# Altium schematic sheet CW341_HyperRam.SchDoc: CW341 HypeRAM
size Letter; Organization: NewAE Technology Inc.; Address1: 1083 Queen St., Suite 196; Address2: Halifax; Address3: NS; Address4: Canada B3H 0B2; SheetNumber: 15; SheetTotal: 16; SheetApproved: YES
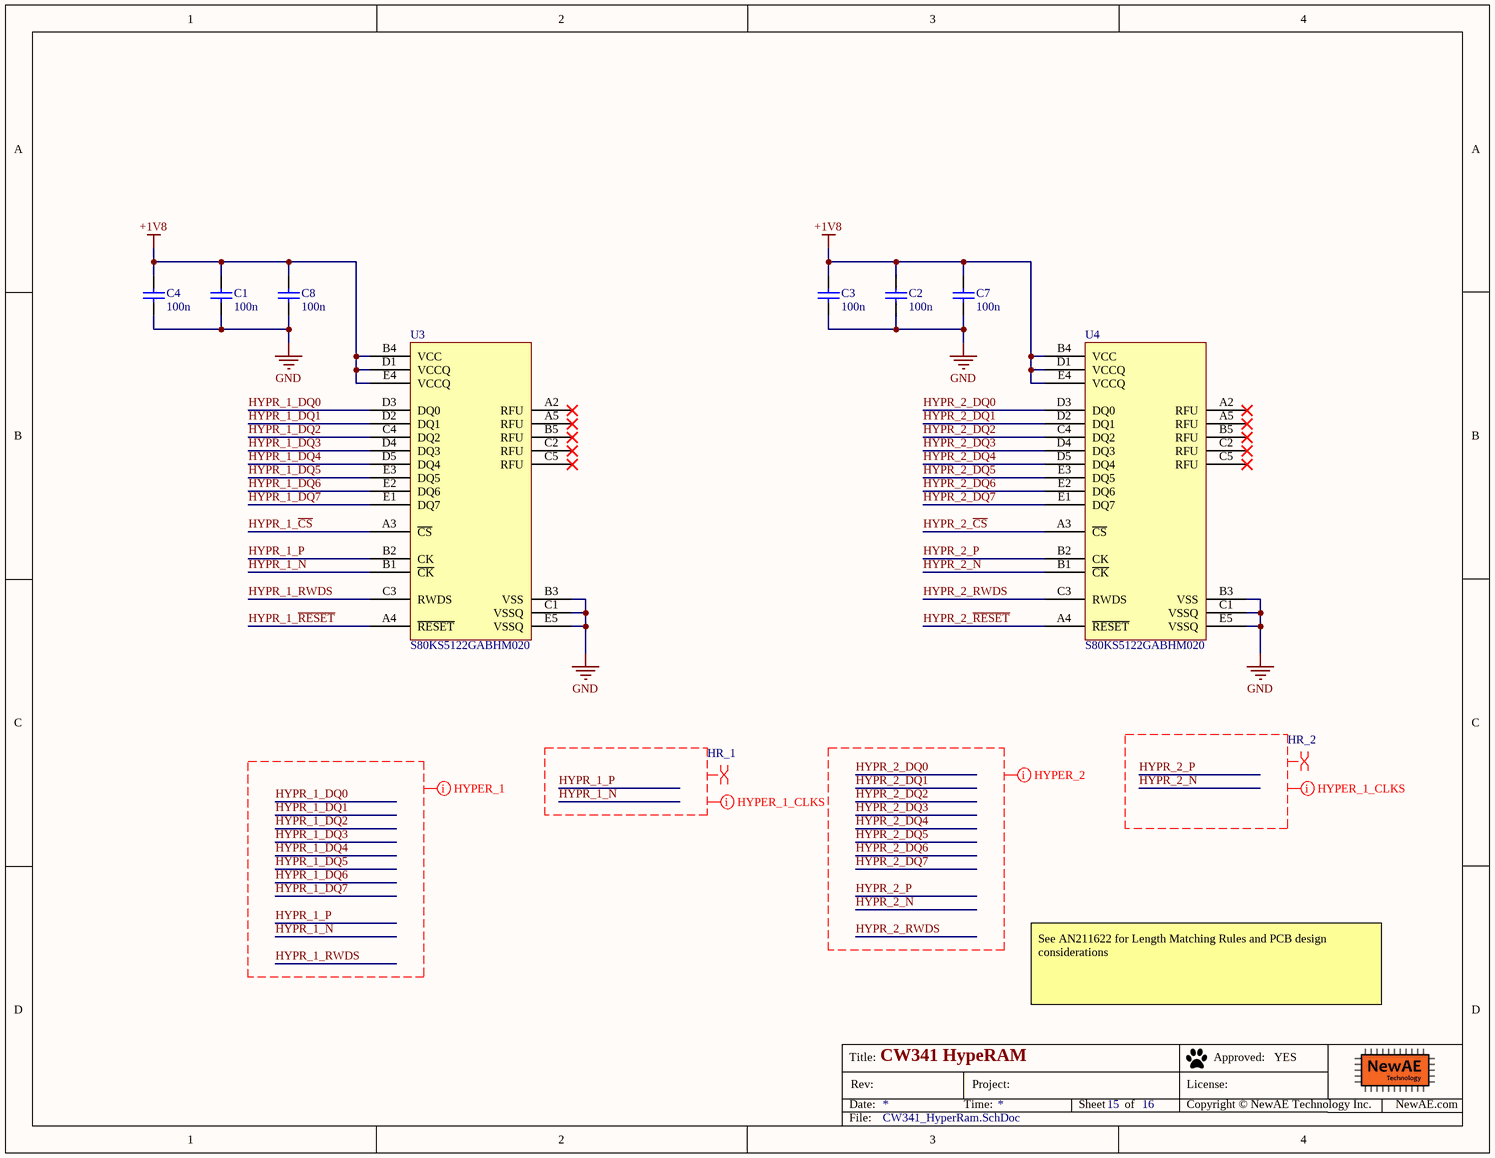
[diagram p0: CW341_HyperRam.SchDoc]

## Parts
C1  100n  [CAPC0402_M]
C2  100n  [CAPC0402_M]
C3  100n  [CAPC0402_M]
C4  100n  [CAPC0402_M]
C7  100n  [CAPC0402_M]
C8  100n  [CAPC0402_M]
U3  PSRAM 512MBIT HYPERBUS 24FBGA  [BGA_24-TBGA_HYPERRAM]  (value not drawn)
U4  PSRAM 512MBIT HYPERBUS 24FBGA  [BGA_24-TBGA_HYPERRAM]  (value not drawn)

## Nets
+1V8: C1.1 C2.1 C3.1 C4.1 C7.1 C8.1 U3.B4(VCC) U3.D1(VCCQ) U3.E4(VCCQ) U4.B4(VCC) U4.D1(VCCQ) U4.E4(VCCQ)
GND: C1.2 C2.2 C3.2 C4.2 C7.2 C8.2 U3.B3(VSS) U3.C1(VSSQ) U3.E5(VSSQ) U4.B3(VSS) U4.C1(VSSQ) U4.E5(VSSQ)
HYPR_1_~{CS}: U3.A3(~{CS})
HYPR_1_DQ0: U3.D3(DQ0)
HYPR_1_DQ1: U3.D2(DQ1)
HYPR_1_DQ2: U3.C4(DQ2)
HYPR_1_DQ3: U3.D4(DQ3)
HYPR_1_DQ4: U3.D5(DQ4)
HYPR_1_DQ5: U3.E3(DQ5)
HYPR_1_DQ6: U3.E2(DQ6)
HYPR_1_DQ7: U3.E1(DQ7)
HYPR_1_N: U3.B1(~{CK})
HYPR_1_P: U3.B2(CK)
HYPR_1_~{RESET}: U3.A4(~{RESET})
HYPR_1_RWDS: U3.C3(RWDS)
HYPR_2_~{CS}: U4.A3(~{CS})
HYPR_2_DQ0: U4.D3(DQ0)
HYPR_2_DQ1: U4.D2(DQ1)
HYPR_2_DQ2: U4.C4(DQ2)
HYPR_2_DQ3: U4.D4(DQ3)
HYPR_2_DQ4: U4.D5(DQ4)
HYPR_2_DQ5: U4.E3(DQ5)
HYPR_2_DQ6: U4.E2(DQ6)
HYPR_2_DQ7: U4.E1(DQ7)
HYPR_2_N: U4.B1(~{CK})
HYPR_2_P: U4.B2(CK)
HYPR_2_~{RESET}: U4.A4(~{RESET})
HYPR_2_RWDS: U4.C3(RWDS)

Not connected (* = marked no-connect by the designer): U3 A2(RFU)* A5(RFU)* B5(RFU)* C2(RFU)* C5(RFU)*; U4 A2(RFU)* A5(RFU)* B5(RFU)* C2(RFU)* C5(RFU)*

## Layout directives
net class HYPER_1_Length: HYPR_1_DQ0, HYPR_1_DQ1, HYPR_1_DQ2, HYPR_1_DQ3, HYPR_1_DQ4, HYPR_1_DQ5, HYPR_1_DQ6, HYPR_1_DQ7, HYPR_1_N, HYPR_1_P, HYPR_1_RWDS
differential pair; differential pair class HR_1: HYPR_1_N, HYPR_1_P
net class HYPER_1_Clks: HYPR_1_N, HYPR_1_P
net class HYPER_2_Length: HYPR_2_DQ0, HYPR_2_DQ1, HYPR_2_DQ2, HYPR_2_DQ3, HYPR_2_DQ4, HYPR_2_DQ5, HYPR_2_DQ6, HYPR_2_DQ7, HYPR_2_N, HYPR_2_P, HYPR_2_RWDS
differential pair; differential pair class HR_2: HYPR_2_N, HYPR_2_P
net class HYPER_2_Clks: HYPR_2_N, HYPR_2_P

## Notes on the sheet
- See AN211622 for Length Matching Rules and PCB design considerations
- Title:
- Date:
- Rev:
- Time:
- Project:
- Sheet
- of
- License:
- Copyright © NewAE Technology Inc.
- Approved:
- NewAE.com
- File:

## Library data of the parts
C1-C4 C7 C8 = CCHIP-100n-0402: 100n, 0402; Manufacture Part Number 1: CGA2B3X7R1V104K050BB; Component Group: Capacitor; Case-EIA: 0402; Part Number: CCHIP-100n-0402; Footprint: 0402; Pin Count: 2; Value: 100n; Mounting Technology: SMT; Component Kind: Standard; Component Type: Standard; Supplier 1: Digi-Key; Supplier Part Number 1: 445-6901-1-ND
U3 U4 = S80KS5122GABHM020: IC PSRAM 512MBIT HYPERBUS 24FBGA; Manufacture 1: Infineon Technologies; Operating Supply Voltage: 1.7V~2V; Access Time: 35ns; Address Bus Width: 8b; Max Supply Voltage: 2.5V; Min Supply Voltage: 0V; Memory Type: RAM,SRAM - Asynchronous,SDR; Memory Size: 512Mb; Max Supply Current: 44mA; Number of Ports: 1; Component Group: Digital IC; PP Material Stack: 0; Supplier 1: Digi-Key; RoHS: Yes; Category: RAM; Stock 1: 1798; Pricing 1: 1=6.76000, 10=6.21600, 25=6.08640, 50=6.06560, 135=5.44252, 270=5.27800, 540=5.01900, 1080=4.84400, 5130=4.35750 (USD); Mount: Surface Mount; Case/Package: 24-VBGA; Number of Pins: 24; Min Operating Temperature: -40°C; Max Operating Temperature: 125°C; Package Quantity: 0; Interface: HyperBus; Density: 512Mbit; Packaging: Tray; Length: 8mm; Width: 6mm; Height: 1mm; Radiation Hardening: No; REACH SVHC: No SVHC; Lead Free: Lead Free; ComponentLink3URL: https://www.infineon.com/dgdl/Infineon-S80KS5122_1.8_V_512-Mbit_HyperBus_Interface_HyperRAM_(Self-Refresh_DRAM)-DataSheet-v01_00-EN.pdf?fileId=8ac78c8c7dc4255f017dd81b77c1088f; ComponentLink3Description: https://datasheet.ciiva.com/9274/as6c8008-9274921.pdf?src-supplier=Avnet; ComponentLink4URL: https://www.infineon.com/dgdl/Infineon-S80KS5122_1.8_V_512-Mbit_HyperBus_Interface_HyperRAM_(Self-Refresh_DRAM)-DataSheet-v01_00-EN.pdf?fileId=8ac78c8c7dc4255f017dd81b77c1088f; ComponentLink4Description: https://datasheet.ciiva.com/1510/32786-1510631.pdf?src-supplier=Element14; Supplier Part Number 1: 1450-1039-ND; .Checked SCH: *; .Checked PCB: *; Part Number: S80KS5122GABHM020; Footprint: TSSOP-44; Manufacture Part Number 1: S80KS5122GABHM020; Pin Count: 24; Mounting Technology: SMT; Component Kind: Standard; Component Type: Standard; PP Rotation: 0; Manufacturer Part Number: S80KS5122GABHM020